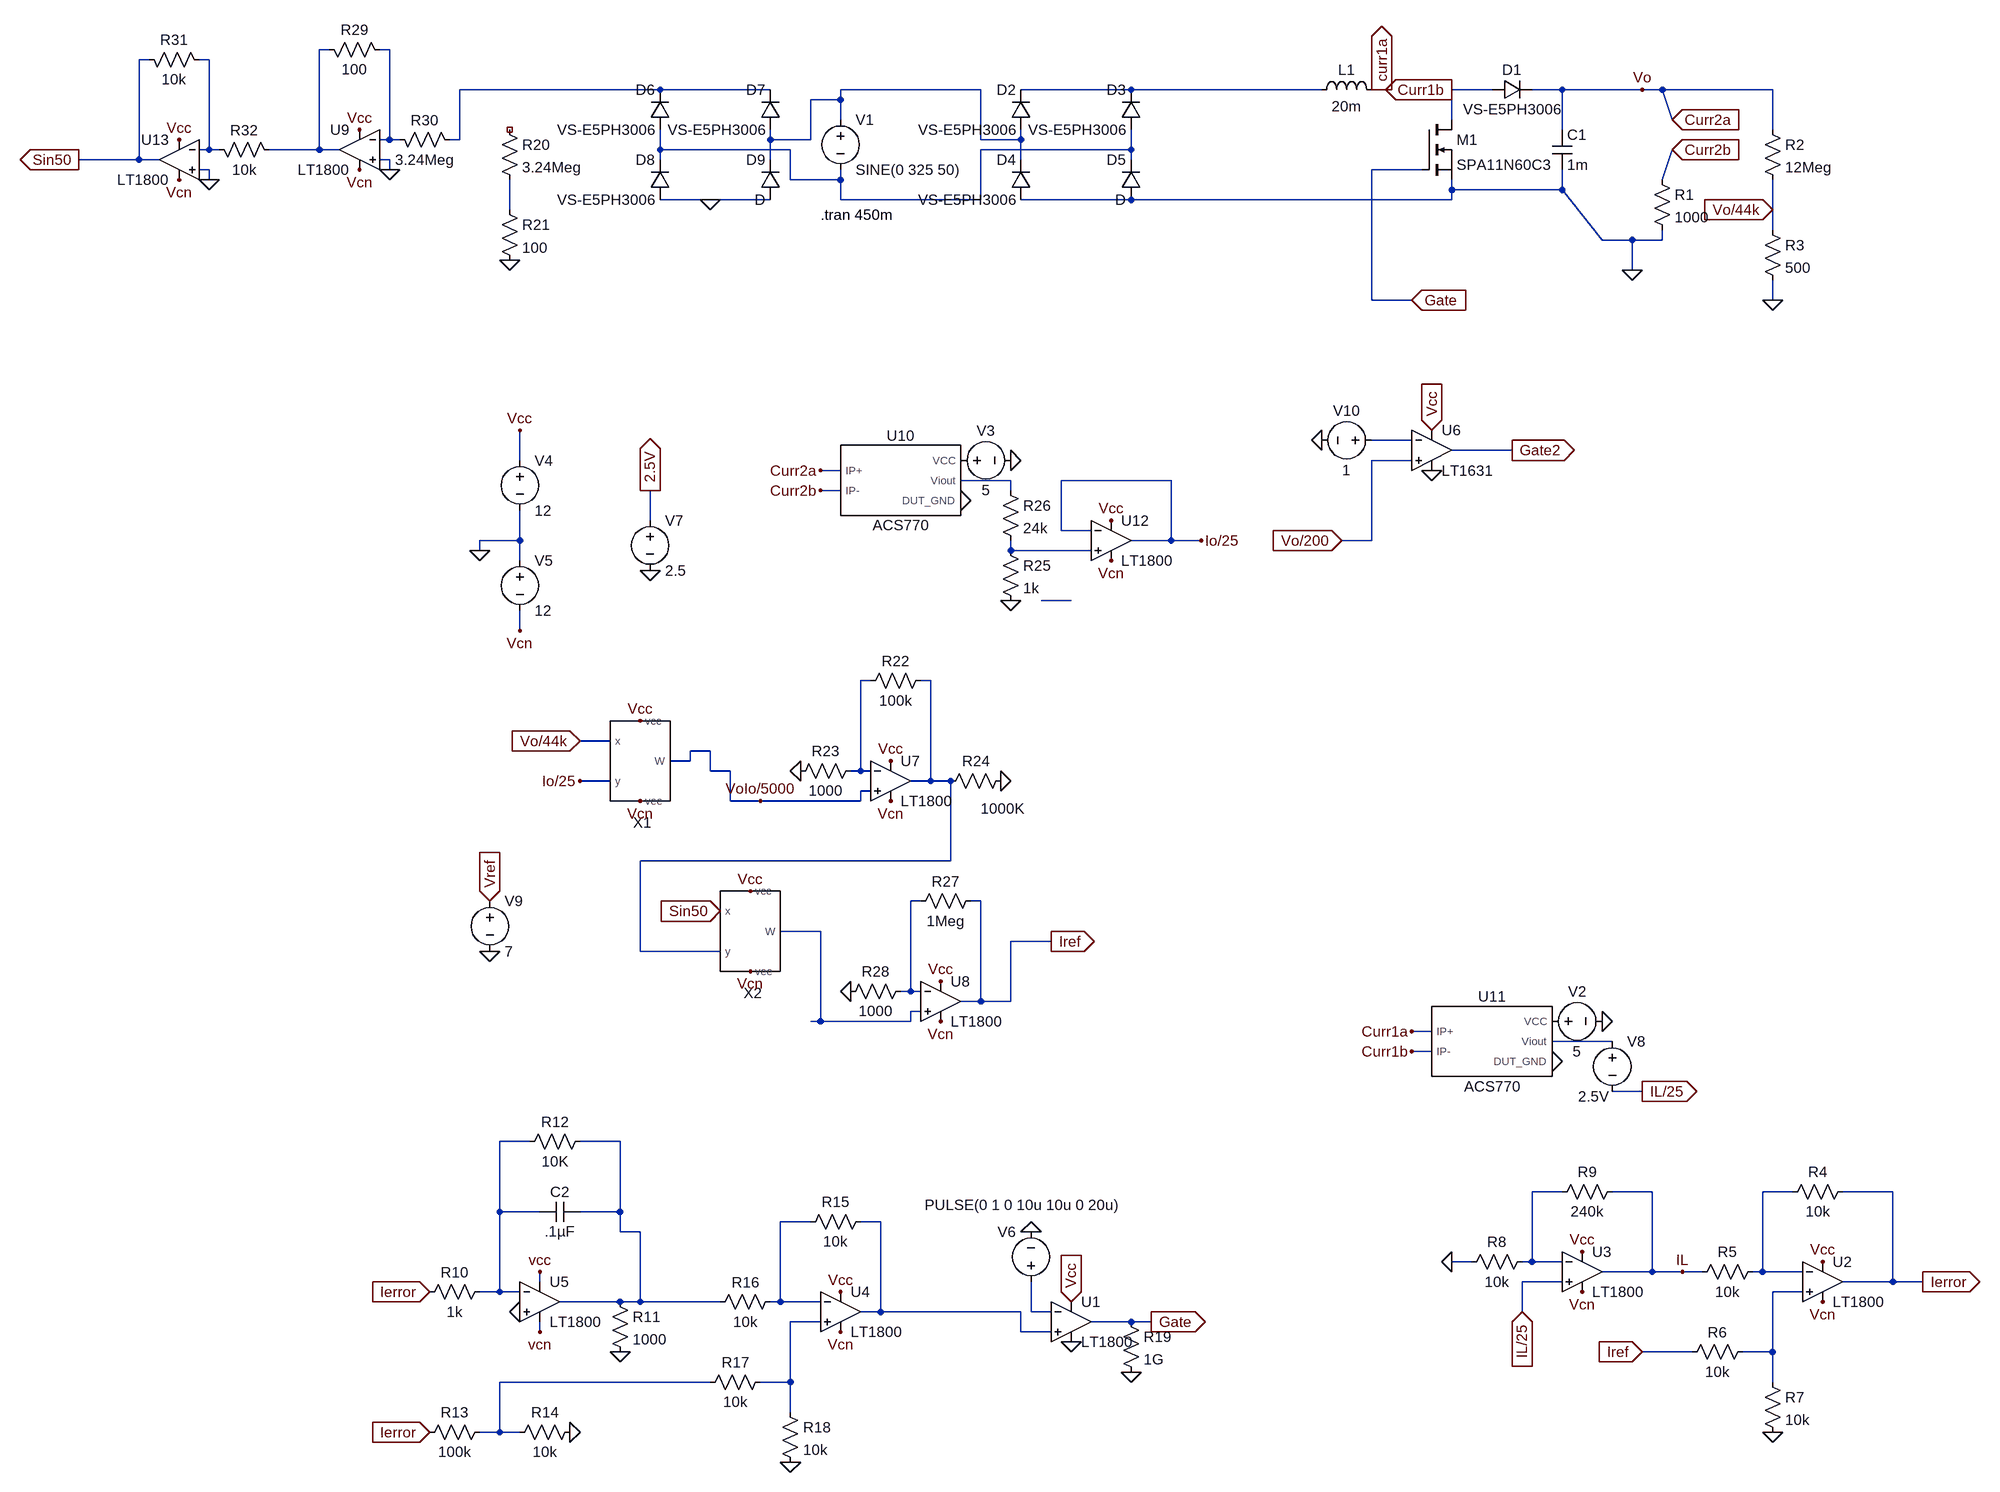
[diagram p0: schematic Test_final.asc]
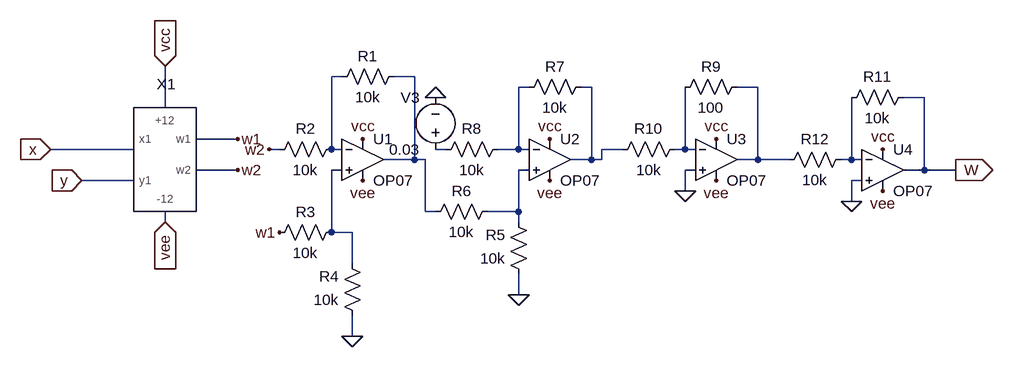
[diagram p1: sub-circuit test_mul_2.asc]
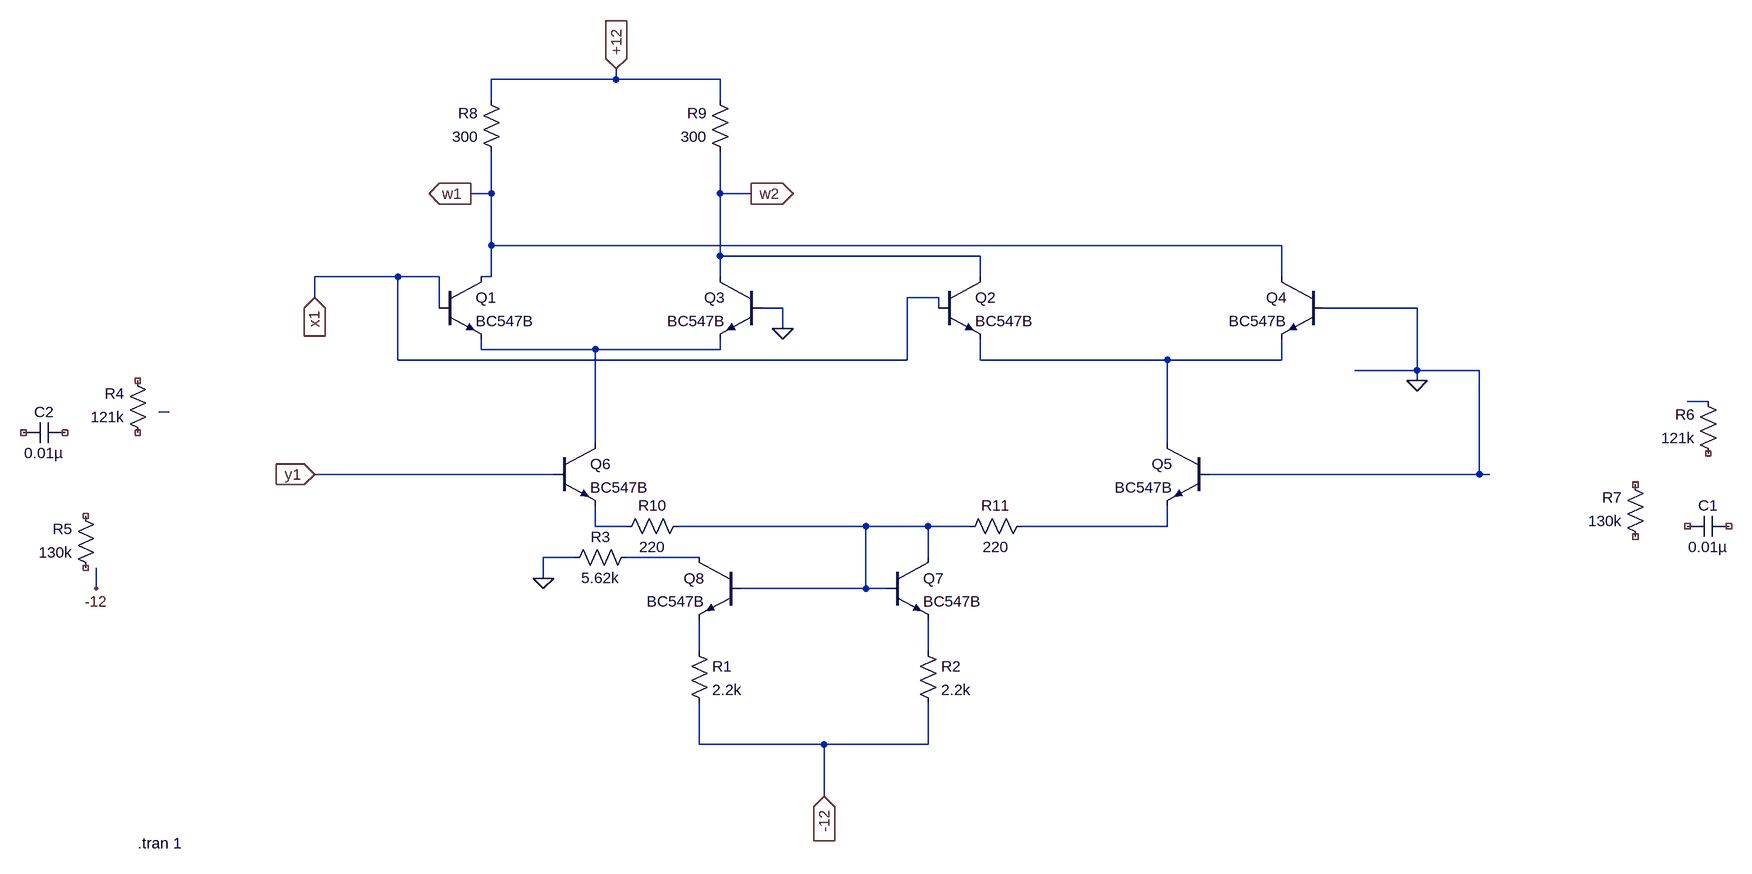
[diagram p2: sub-circuit multipeir_3.asc]
Test_final.asc, the LTspice schematic file:
Version 4.1
SHEET 1 2080 1320
WIRE -592 -960 -608 -960
WIRE -496 -960 -512 -960
WIRE -880 -944 -896 -944
WIRE -784 -944 -800 -944
WIRE -64 -896 -384 -896
WIRE 112 -896 -64 -896
WIRE 448 -896 224 -896
WIRE 688 -896 512 -896
WIRE 992 -896 688 -896
WIRE 1088 -896 1072 -896
WIRE 1104 -896 1088 -896
WIRE 1264 -896 1200 -896
WIRE 1376 -896 1328 -896
WIRE 1504 -896 1376 -896
WIRE 1536 -896 1504 -896
WIRE 1712 -896 1536 -896
WIRE 224 -880 224 -896
WIRE 224 -880 176 -880
WIRE 224 -848 224 -880
WIRE 1200 -848 1200 -896
WIRE 1552 -848 1536 -896
WIRE 1376 -832 1376 -896
WIRE 1712 -832 1712 -896
WIRE -496 -816 -496 -960
WIRE -496 -816 -512 -816
WIRE -480 -816 -496 -816
WIRE -384 -816 -384 -896
WIRE -384 -816 -400 -816
WIRE 112 -816 112 -832
WIRE 176 -816 176 -880
WIRE 176 -816 112 -816
WIRE 448 -816 448 -896
WIRE 512 -816 512 -832
WIRE 512 -816 448 -816
WIRE -784 -800 -784 -944
WIRE -784 -800 -800 -800
WIRE -768 -800 -784 -800
WIRE -608 -800 -608 -960
WIRE -608 -800 -688 -800
WIRE -576 -800 -608 -800
WIRE -64 -800 -64 -832
WIRE 144 -800 -64 -800
WIRE 688 -800 688 -832
WIRE 688 -800 448 -800
WIRE -896 -784 -896 -944
WIRE -896 -784 -992 -784
WIRE -864 -784 -896 -784
WIRE -496 -784 -512 -784
WIRE -64 -784 -64 -800
WIRE 112 -784 112 -816
WIRE 512 -784 512 -816
WIRE 688 -784 688 -800
WIRE -784 -768 -800 -768
WIRE -496 -768 -496 -784
WIRE 1152 -768 1072 -768
WIRE -784 -752 -784 -768
WIRE 144 -752 144 -800
WIRE 224 -752 224 -768
WIRE 224 -752 144 -752
WIRE 1536 -752 1552 -800
WIRE 1200 -736 1200 -752
WIRE 1376 -736 1376 -768
WIRE 1376 -736 1200 -736
WIRE 16 -720 -64 -720
WIRE 112 -720 16 -720
WIRE 224 -720 224 -752
WIRE 448 -720 448 -800
WIRE 448 -720 224 -720
WIRE 688 -720 512 -720
WIRE 1200 -720 1200 -736
WIRE 1200 -720 688 -720
WIRE -304 -704 -304 -752
WIRE 1712 -704 1712 -752
WIRE 1712 -672 1712 -704
WIRE 1440 -656 1376 -736
WIRE 1488 -656 1440 -656
WIRE 1536 -656 1536 -672
WIRE 1536 -656 1488 -656
WIRE 1488 -608 1488 -656
WIRE 1072 -560 1072 -768
WIRE 1136 -560 1072 -560
WIRE 1712 -560 1712 -592
WIRE 1136 -336 1072 -336
WIRE 1296 -320 1200 -320
WIRE -288 -304 -288 -352
WIRE 1136 -304 1072 -304
WIRE 224 -288 192 -288
WIRE 496 -272 416 -272
WIRE 752 -272 576 -272
WIRE 224 -256 192 -256
WIRE 496 -256 496 -272
WIRE -80 -208 -80 -256
WIRE 576 -192 576 -272
WIRE 624 -192 576 -192
WIRE -288 -176 -288 -224
WIRE -288 -176 -352 -176
WIRE 752 -176 752 -272
WIRE 752 -176 688 -176
WIRE 800 -176 752 -176
WIRE 1072 -176 1072 -304
WIRE 1072 -176 1024 -176
WIRE -352 -160 -352 -176
WIRE 496 -160 496 -176
WIRE 624 -160 496 -160
WIRE -288 -144 -288 -176
WIRE 592 -80 544 -80
WIRE -288 -32 -288 -64
WIRE 272 48 256 48
WIRE 368 48 352 48
WIRE -144 144 -192 144
WIRE 16 160 -16 160
WIRE -16 176 -16 160
WIRE -16 176 -48 176
WIRE 16 192 16 160
WIRE 48 192 16 192
WIRE 256 192 256 48
WIRE 256 192 240 192
WIRE 272 192 256 192
WIRE -144 208 -192 208
WIRE 368 208 368 48
WIRE 368 208 336 208
WIRE 400 208 368 208
WIRE 272 224 256 224
WIRE 48 240 48 192
WIRE 96 240 48 240
WIRE 256 240 256 224
WIRE 256 240 96 240
WIRE 400 336 400 208
WIRE 400 336 -96 336
WIRE 352 400 336 400
WIRE 448 400 432 400
WIRE 192 448 128 448
WIRE 560 464 496 464
WIRE -96 480 -96 336
WIRE 32 480 -96 480
WIRE 336 544 336 400
WIRE 336 544 320 544
WIRE 352 544 336 544
WIRE 448 560 448 400
WIRE 448 560 416 560
WIRE 496 560 496 464
WIRE 496 560 448 560
WIRE 352 576 336 576
WIRE 192 592 192 448
WIRE 192 592 176 592
WIRE 336 592 336 576
WIRE 336 592 192 592
WIRE 1168 608 1136 608
WIRE 1456 624 1360 624
WIRE 1168 640 1136 640
WIRE 1504 704 1456 704
WIRE -272 784 -320 784
WIRE -128 784 -192 784
WIRE 1376 864 1328 864
WIRE 1520 864 1456 864
WIRE 1744 864 1696 864
WIRE 1904 864 1824 864
WIRE -320 896 -320 784
WIRE -256 896 -320 896
WIRE -128 896 -128 784
WIRE -128 896 -192 896
WIRE 176 912 128 912
WIRE 288 912 256 912
WIRE -128 928 -128 896
WIRE -96 928 -128 928
WIRE 1232 976 1200 976
WIRE 1328 976 1328 864
WIRE 1328 976 1312 976
WIRE 1376 976 1328 976
WIRE 1520 992 1520 864
WIRE 1520 992 1440 992
WIRE 1568 992 1520 992
WIRE 1600 992 1568 992
WIRE 1696 992 1696 864
WIRE 1696 992 1680 992
WIRE 1760 992 1696 992
WIRE -256 1008 -256 992
WIRE 1376 1008 1312 1008
WIRE 1904 1008 1904 864
WIRE 1904 1008 1824 1008
WIRE 1952 1008 1904 1008
WIRE -320 1024 -320 896
WIRE -320 1024 -352 1024
WIRE -288 1024 -320 1024
WIRE 1760 1024 1712 1024
WIRE -128 1040 -224 1040
WIRE -96 1040 -96 928
WIRE -96 1040 -128 1040
WIRE 32 1040 -96 1040
WIRE 128 1040 128 912
WIRE 128 1040 112 1040
WIRE 192 1040 128 1040
WIRE 288 1056 288 912
WIRE 288 1056 256 1056
WIRE 512 1056 288 1056
WIRE 528 1056 528 1008
WIRE 560 1056 528 1056
WIRE 1312 1056 1312 1008
WIRE 192 1072 144 1072
WIRE 688 1072 624 1072
WIRE 720 1072 688 1072
WIRE -256 1088 -256 1072
WIRE 512 1088 512 1056
WIRE 560 1088 512 1088
WIRE 1584 1120 1504 1120
WIRE 1712 1120 1712 1024
WIRE 1712 1120 1664 1120
WIRE 16 1168 -320 1168
WIRE 144 1168 144 1072
WIRE 144 1168 96 1168
WIRE 1712 1168 1712 1120
WIRE 144 1216 144 1168
WIRE -320 1248 -320 1168
WIRE -320 1248 -352 1248
WIRE -288 1248 -320 1248
FLAG 1712 -560 0
FLAG 1712 -704 Vo/44k
IOPIN 1712 -704 In
FLAG 1504 -896 Vo
FLAG 1088 -896 curr1a
IOPIN 1088 -896 Out
FLAG 1200 -896 Curr1b
IOPIN 1200 -896 Out
FLAG 1136 608 Curr1a
FLAG 1136 640 Curr1b
FLAG 1440 592 0
FLAG 1360 656 0
FLAG 192 -288 Curr2a
FLAG 192 -256 Curr2b
FLAG 496 -304 0
FLAG 416 -240 0
FLAG 1552 -848 Curr2a
IOPIN 1552 -848 In
FLAG 1552 -800 Curr2b
IOPIN 1552 -800 In
FLAG -288 -32 Vcn
FLAG -288 -352 Vcc
FLAG -352 -160 0
FLAG 1712 1248 0
FLAG 1792 976 Vcc
FLAG 1792 1040 Vcn
FLAG 1408 960 Vcc
FLAG 1408 1024 Vcn
FLAG 1312 1056 IL/25
IOPIN 1312 1056 In
FLAG 1200 976 0
FLAG 1504 1120 Iref
IOPIN 1504 1120 In
FLAG 1568 992 IL
FLAG 1952 1008 Ierror
IOPIN 1952 1008 Out
FLAG -256 992 vcc
FLAG -256 1088 vcn
FLAG -288 1056 0
FLAG -128 1120 0
FLAG -432 1024 Ierror
IOPIN -432 1024 In
FLAG -432 1248 Ierror
IOPIN -432 1248 In
FLAG -208 1248 0
FLAG 144 1296 0
FLAG 224 1024 Vcc
FLAG 224 1088 Vcn
FLAG 528 928 0
FLAG 592 1104 0
FLAG 592 1040 Vcc
IOPIN 592 1040 In
FLAG 720 1072 Gate
IOPIN 720 1072 Out
FLAG 688 1152 0
FLAG 1136 -560 Gate
IOPIN 1136 -560 In
FLAG -304 -624 0
FLAG -992 -784 Sin50
IOPIN -992 -784 Out
FLAG 16 -720 0
FLAG -80 -128 0
FLAG -80 -256 2.5V
IOPIN -80 -256 Out
FLAG 1504 704 IL/25
IOPIN 1504 704 Out
FLAG -192 144 Vo/44k
IOPIN -192 144 In
FLAG 32 416 Sin50
IOPIN 32 416 In
FLAG 1168 -352 Vcc
IOPIN 1168 -352 In
FLAG 160 192 0
FLAG 480 208 0
FLAG 96 240 VoIo/5000
FLAG 560 464 Iref
IOPIN 560 464 Out
FLAG -336 480 0
FLAG -336 400 Vref
IOPIN -336 400 In
FLAG 1168 -288 0
FLAG 992 -336 0
FLAG 1024 -176 Vo/200
IOPIN 1024 -176 In
FLAG 1488 -608 0
FLAG 1296 -320 Gate2
IOPIN 1296 -320 Out
FLAG 304 176 Vcc
FLAG 304 240 Vcn
FLAG 496 -80 0
FLAG -96 240 Vcn
FLAG -96 112 Vcc
FLAG 80 512 Vcn
FLAG 80 384 Vcc
FLAG -192 208 Io/25
FLAG 656 -208 Vcc
FLAG 656 -144 Vcn
FLAG 800 -176 Io/25
FLAG 240 544 0
FLAG 384 528 Vcc
FLAG 384 592 Vcn
FLAG -496 -768 0
FLAG -544 -832 Vcc
FLAG -544 -768 Vcn
FLAG -784 -752 0
FLAG -832 -816 Vcc
FLAG -832 -752 Vcn
SYMBOL ind 976 -880 R270
WINDOW 0 32 56 VTop 2
WINDOW 3 5 56 VBottom 2
SYMATTR InstName L1
SYMATTR Value 20m
SYMBOL cap 1360 -832 R0
SYMATTR InstName C1
SYMATTR Value 1m
SYMBOL nmos 1152 -848 R0
SYMATTR InstName M1
SYMATTR Value SPA11N60C3
SYMBOL res 1520 -768 R0
SYMATTR InstName R1
SYMATTR Value 1000
SYMBOL diode 1264 -880 R270
WINDOW 0 32 32 VTop 2
WINDOW 3 0 32 VBottom 2
SYMATTR InstName D1
SYMATTR Value VS-E5PH3006
SYMBOL diode 528 -832 R180
WINDOW 0 24 64 Left 2
WINDOW 3 24 0 Left 2
SYMATTR InstName D2
SYMATTR Value VS-E5PH3006
SYMBOL diode 704 -832 R180
WINDOW 0 24 64 Left 2
WINDOW 3 24 0 Left 2
SYMATTR InstName D3
SYMATTR Value VS-E5PH3006
SYMBOL diode 528 -720 R180
WINDOW 0 24 64 Left 2
WINDOW 3 24 0 Left 2
SYMATTR InstName D4
SYMATTR Value VS-E5PH3006
SYMBOL diode 704 -720 R180
WINDOW 0 24 64 Left 2
WINDOW 3 24 0 Left 2
SYMATTR InstName D5
SYMBOL voltage 224 -864 R0
WINDOW 123 0 0 Left 0
WINDOW 39 0 0 Left 0
SYMATTR InstName V1
SYMATTR Value SINE(0 325 50)
SYMBOL res 1696 -848 R0
SYMATTR InstName R2
SYMATTR Value 12Meg
SYMBOL res 1696 -688 R0
SYMATTR InstName R3
SYMATTR Value 500
SYMBOL voltage 1344 592 R270
WINDOW 0 32 56 VTop 2
WINDOW 3 -32 56 VBottom 2
SYMATTR InstName V2
SYMATTR Value 5
SYMBOL voltage 400 -304 R270
WINDOW 0 32 56 VTop 2
WINDOW 3 -32 56 VBottom 2
SYMATTR InstName V3
SYMATTR Value 5
SYMBOL voltage -288 -320 R0
WINDOW 123 0 0 Left 0
WINDOW 39 0 0 Left 0
SYMATTR InstName V4
SYMATTR Value 12
SYMBOL voltage -288 -160 R0
WINDOW 123 0 0 Left 0
WINDOW 39 0 0 Left 0
SYMATTR InstName V5
SYMATTR Value 12
SYMBOL res 1840 848 R90
WINDOW 0 0 56 VBottom 2
WINDOW 3 32 56 VTop 2
SYMATTR InstName R4
SYMATTR Value 10k
SYMBOL res 1584 1008 R270
WINDOW 0 32 56 VTop 2
WINDOW 3 0 56 VBottom 2
SYMATTR InstName R5
SYMATTR Value 10k
SYMBOL res 1568 1136 R270
WINDOW 0 32 56 VTop 2
WINDOW 3 0 56 VBottom 2
SYMATTR InstName R6
SYMATTR Value 10k
SYMBOL res 1696 1152 R0
SYMATTR InstName R7
SYMATTR Value 10k
SYMBOL res 1328 960 R90
WINDOW 0 0 56 VBottom 2
WINDOW 3 32 56 VTop 2
SYMATTR InstName R8
SYMATTR Value 10k
SYMBOL res 1472 848 R90
WINDOW 0 0 56 VBottom 2
WINDOW 3 32 56 VTop 2
SYMATTR InstName R9
SYMATTR Value 240k
SYMBOL res -336 1008 R90
WINDOW 0 0 56 VBottom 2
WINDOW 3 32 56 VTop 2
SYMATTR InstName R10
SYMATTR Value 1k
SYMBOL res -144 1024 R0
SYMATTR InstName R11
SYMATTR Value 1000
SYMBOL cap -192 880 R90
WINDOW 0 0 32 VBottom 2
WINDOW 3 32 32 VTop 2
SYMATTR InstName C2
SYMATTR Value .1µF
SYMBOL res -176 768 R90
WINDOW 0 0 56 VBottom 2
WINDOW 3 32 56 VTop 2
SYMATTR InstName R12
SYMATTR Value 10K
SYMBOL res -336 1232 R90
WINDOW 0 0 56 VBottom 2
WINDOW 3 32 56 VTop 2
SYMATTR InstName R13
SYMATTR Value 100k
SYMBOL res -192 1232 R90
WINDOW 0 0 56 VBottom 2
WINDOW 3 32 56 VTop 2
SYMATTR InstName R14
SYMATTR Value 10k
SYMBOL res 272 896 R90
WINDOW 0 0 56 VBottom 2
WINDOW 3 32 56 VTop 2
SYMATTR InstName R15
SYMATTR Value 10k
SYMBOL res 16 1056 R270
WINDOW 0 32 56 VTop 2
WINDOW 3 0 56 VBottom 2
SYMATTR InstName R16
SYMATTR Value 10k
SYMBOL res 0 1184 R270
WINDOW 0 32 56 VTop 2
WINDOW 3 0 56 VBottom 2
SYMATTR InstName R17
SYMATTR Value 10k
SYMBOL res 128 1200 R0
SYMATTR InstName R18
SYMATTR Value 10k
SYMBOL voltage 528 1024 R180
WINDOW 0 24 96 Left 2
WINDOW 3 -141 139 Left 2
WINDOW 123 0 0 Left 0
WINDOW 39 0 0 Left 0
SYMATTR InstName V6
SYMATTR Value PULSE(0 1 0 10u 10u 0 20u)
SYMBOL res 672 1056 R0
SYMATTR InstName R19
SYMATTR Value 1G
SYMBOL diode -48 -832 R180
WINDOW 0 24 64 Left 2
WINDOW 3 24 0 Left 2
SYMATTR InstName D6
SYMATTR Value VS-E5PH3006
SYMBOL diode 128 -832 R180
WINDOW 0 24 64 Left 2
WINDOW 3 24 0 Left 2
SYMATTR InstName D7
SYMATTR Value VS-E5PH3006
SYMBOL diode -48 -720 R180
WINDOW 0 24 64 Left 2
WINDOW 3 24 0 Left 2
SYMATTR InstName D8
SYMATTR Value VS-E5PH3006
SYMBOL diode 128 -720 R180
WINDOW 0 24 64 Left 2
WINDOW 3 24 0 Left 2
SYMATTR InstName D9
SYMBOL res -320 -848 R0
SYMATTR InstName R20
SYMATTR Value 3.24Meg
SYMBOL res -320 -720 R0
SYMATTR InstName R21
SYMATTR Value 100
SYMBOL voltage -80 -224 R0
SYMATTR InstName V7
SYMATTR Value 2.5
SYMBOL OpAmps\\LT1800 592 1008 R0
SYMATTR InstName U1
SYMBOL OpAmps\\LT1800 1792 944 R0
SYMATTR InstName U2
SYMBOL OpAmps\\LT1800 1408 928 R0
SYMATTR InstName U3
SYMBOL OpAmps\\LT1800 224 992 R0
SYMATTR InstName U4
SYMBOL OpAmps\\LT1800 -256 976 R0
SYMATTR InstName U5
SYMBOL voltage 1456 608 R0
WINDOW 3 -54 104 Left 2
SYMATTR Value 2.5V
SYMATTR InstName V8
SYMBOL OpAmps\\LT1631 1168 -384 R0
SYMATTR InstName U6
SYMBOL res 368 32 R90
WINDOW 0 0 56 VBottom 2
WINDOW 3 32 56 VTop 2
SYMATTR InstName R22
SYMATTR Value 100k
SYMBOL res 256 176 R90
WINDOW 0 0 56 VBottom 2
WINDOW 3 32 56 VTop 2
SYMATTR InstName R23
SYMATTR Value 1000
SYMBOL res 496 192 R90
WINDOW 0 0 56 VBottom 2
WINDOW 3 44 13 VTop 2
SYMATTR InstName R24
SYMATTR Value 1000K
SYMBOL voltage -336 384 R0
SYMATTR InstName V9
SYMATTR Value 7
SYMBOL voltage 1088 -336 R90
WINDOW 0 -32 56 VBottom 2
WINDOW 3 32 56 VTop 2
WINDOW 123 0 0 Left 0
WINDOW 39 0 0 Left 0
SYMATTR InstName V10
SYMATTR Value 1
SYMBOL OpAmps\\LT1800 304 144 R0
SYMATTR InstName U7
SYMBOL ACS770 320 -272 R0
SYMATTR InstName U10
SYMBOL ACS770 1264 624 R0
SYMATTR InstName U11
SYMBOL res 480 -176 R0
SYMATTR InstName R25
SYMATTR Value 1k
SYMBOL res 480 -272 R0
SYMATTR InstName R26
SYMATTR Value 24k
SYMBOL test_mul_2 -96 192 R0
SYMATTR InstName X1
SYMBOL test_mul_2 80 464 R0
SYMATTR InstName X2
SYMBOL OpAmps\\LT1800 656 -240 R0
SYMATTR InstName U12
SYMBOL res 448 384 R90
WINDOW 0 0 56 VBottom 2
WINDOW 3 32 56 VTop 2
SYMATTR InstName R27
SYMATTR Value 1Meg
SYMBOL res 336 528 R90
WINDOW 0 0 56 VBottom 2
WINDOW 3 32 56 VTop 2
SYMATTR InstName R28
SYMATTR Value 1000
SYMBOL OpAmps\\LT1800 384 496 R0
SYMATTR InstName U8
SYMBOL res -608 -976 M90
WINDOW 0 0 56 VBottom 2
WINDOW 3 32 56 VTop 2
SYMATTR InstName R29
SYMATTR Value 100
SYMBOL res -496 -832 M90
WINDOW 0 0 56 VBottom 2
WINDOW 3 32 56 VTop 2
SYMATTR InstName R30
SYMATTR Value 3.24Meg
SYMBOL OpAmps\\LT1800 -544 -864 M0
SYMATTR InstName U9
SYMBOL res -896 -960 M90
WINDOW 0 0 56 VBottom 2
WINDOW 3 32 56 VTop 2
SYMATTR InstName R31
SYMATTR Value 10k
SYMBOL res -784 -816 M90
WINDOW 0 0 56 VBottom 2
WINDOW 3 32 56 VTop 2
SYMATTR InstName R32
SYMATTR Value 10k
SYMBOL OpAmps\\LT1800 -832 -848 M0
SYMATTR InstName U13
TEXT 192 -696 Left 2 !.tran 450m

test_mul_2.asc, the sub-circuit schematic file:
Version 4.1
SHEET 1 900 680
WIRE -128 -32 -144 -32
WIRE -16 -32 -48 -32
WIRE 160 -16 144 -16
WIRE 256 -16 240 -16
WIRE 512 -16 480 -16
WIRE 768 0 736 0
WIRE -400 16 -400 -48
WIRE -288 64 -352 64
WIRE -448 80 -448 64
WIRE -448 80 -576 80
WIRE -224 80 -240 80
WIRE -144 80 -144 -32
WIRE -128 80 -144 80
WIRE 32 80 16 80
WIRE 144 80 144 -16
WIRE 144 80 112 80
WIRE 160 80 144 80
WIRE 304 80 272 80
WIRE 400 80 400 -16
WIRE 400 80 384 80
WIRE 416 80 400 80
WIRE -16 96 -16 -32
WIRE -16 96 -64 96
WIRE 0 96 -16 96
WIRE 256 96 256 -16
WIRE 256 96 224 96
WIRE 272 96 272 80
WIRE 272 96 256 96
WIRE 512 96 512 -16
WIRE 512 96 480 96
WIRE 560 96 512 96
WIRE 656 96 656 0
WIRE 656 96 640 96
WIRE 672 96 656 96
WIRE -288 112 -352 112
WIRE -128 112 -144 112
WIRE 160 112 144 112
WIRE 416 112 400 112
WIRE 768 112 768 0
WIRE 768 112 736 112
WIRE 816 112 768 112
WIRE -448 128 -528 128
WIRE 672 128 656 128
WIRE 400 144 400 112
WIRE 656 160 656 128
WIRE 0 176 0 96
WIRE 16 176 0 176
WIRE 144 176 144 112
WIRE 144 176 96 176
WIRE -400 192 -400 176
WIRE 144 192 144 176
WIRE -144 208 -144 112
WIRE -112 208 -144 208
WIRE -112 256 -112 208
WIRE 144 304 144 272
WIRE -112 368 -112 336
FLAG -288 64 w1
FLAG -288 112 w2
FLAG -112 368 0
FLAG -240 80 w2
FLAG -224 208 w1
FLAG 400 144 0
FLAG 144 304 0
FLAG -400 -48 vcc
IOPIN -400 -48 In
FLAG -96 64 vcc
FLAG 192 64 vcc
FLAG 448 64 vcc
FLAG 448 128 vee
FLAG 192 128 vee
FLAG -96 128 vee
FLAG -400 192 vee
IOPIN -400 192 In
FLAG 16 0 0
FLAG 656 160 0
FLAG 704 80 vcc
FLAG 704 144 vee
FLAG -576 80 x
IOPIN -576 80 In
FLAG -528 128 y
IOPIN -528 128 In
FLAG 816 112 W
IOPIN 816 112 Out
SYMBOL multipeir_3 -400 96 R0
SYMATTR InstName X1
SYMBOL OpAmps\\OP07 -96 32 R0
SYMATTR InstName U1
SYMBOL OpAmps\\OP07 192 32 R0
SYMATTR InstName U2
SYMBOL OpAmps\\OP07 448 32 R0
SYMATTR InstName U3
SYMBOL res -32 -48 R90
WINDOW 0 0 56 VBottom 2
WINDOW 3 32 56 VTop 2
SYMATTR InstName R1
SYMATTR Value 10k
SYMBOL res -128 64 R90
WINDOW 0 0 56 VBottom 2
WINDOW 3 32 56 VTop 2
SYMATTR InstName R2
SYMATTR Value 10k
SYMBOL res -128 192 R90
WINDOW 0 0 56 VBottom 2
WINDOW 3 32 56 VTop 2
SYMATTR InstName R3
SYMATTR Value 10k
SYMBOL res -96 352 R180
WINDOW 0 36 76 Left 2
WINDOW 3 36 40 Left 2
SYMATTR InstName R4
SYMATTR Value 10k
SYMBOL res 160 288 R180
WINDOW 0 36 76 Left 2
WINDOW 3 36 40 Left 2
SYMATTR InstName R5
SYMATTR Value 10k
SYMBOL res 0 192 R270
WINDOW 0 32 56 VTop 2
WINDOW 3 0 56 VBottom 2
SYMATTR InstName R6
SYMATTR Value 10k
SYMBOL res 144 0 R270
WINDOW 0 32 56 VTop 2
WINDOW 3 0 56 VBottom 2
SYMATTR InstName R7
SYMATTR Value 10k
SYMBOL res 16 96 R270
WINDOW 0 32 56 VTop 2
WINDOW 3 0 56 VBottom 2
SYMATTR InstName R8
SYMATTR Value 10k
SYMBOL res 496 -32 R90
WINDOW 0 0 56 VBottom 2
WINDOW 3 32 56 VTop 2
SYMATTR InstName R9
SYMATTR Value 100
SYMBOL res 400 64 R90
WINDOW 0 0 56 VBottom 2
WINDOW 3 32 56 VTop 2
SYMATTR InstName R10
SYMATTR Value 10k
SYMBOL voltage 16 96 R180
WINDOW 0 24 96 Left 2
WINDOW 3 24 16 Left 2
WINDOW 123 0 0 Left 0
WINDOW 39 0 0 Left 0
SYMATTR InstName V3
SYMATTR Value 0.03
SYMBOL OpAmps\\OP07 704 48 R0
SYMATTR InstName U4
SYMBOL res 752 -16 R90
WINDOW 0 0 56 VBottom 2
WINDOW 3 32 56 VTop 2
SYMATTR InstName R11
SYMATTR Value 10k
SYMBOL res 656 80 R90
WINDOW 0 0 56 VBottom 2
WINDOW 3 32 56 VTop 2
SYMATTR InstName R12
SYMATTR Value 10k

multipeir_3.asc, the sub-circuit schematic file:
Version 4.1
SHEET 1 2080 996
WIRE 240 -208 240 -224
WIRE 240 -208 48 -208
WIRE 400 -208 240 -208
WIRE 48 -176 48 -208
WIRE 400 -176 400 -208
WIRE 48 -32 48 -96
WIRE 48 -32 16 -32
WIRE 400 -32 400 -96
WIRE 448 -32 400 -32
WIRE 48 48 48 -32
WIRE 1264 48 48 48
WIRE 400 64 400 -32
WIRE 800 64 400 64
WIRE -96 96 -224 96
WIRE -32 96 -96 96
WIRE 48 96 48 48
WIRE 48 96 32 96
WIRE 400 96 400 64
WIRE 800 96 800 64
WIRE 1264 96 1264 48
WIRE -224 128 -224 96
WIRE 736 128 688 128
WIRE -32 144 -32 96
WIRE 496 144 464 144
WIRE 736 144 736 128
WIRE 1472 144 1328 144
WIRE 496 176 496 144
WIRE 32 208 32 192
WIRE 208 208 32 208
WIRE 400 208 400 192
WIRE 400 208 208 208
WIRE -96 224 -96 96
WIRE 688 224 688 128
WIRE 688 224 -96 224
WIRE 800 224 800 192
WIRE 1088 224 800 224
WIRE 1264 224 1264 192
WIRE 1264 224 1088 224
WIRE 1472 240 1472 144
WIRE 1472 240 1376 240
WIRE 1568 240 1472 240
WIRE 1472 256 1472 240
WIRE 1920 288 1888 288
WIRE -448 304 -464 304
WIRE 208 352 208 208
WIRE 1088 352 1088 224
WIRE 144 400 -224 400
WIRE 1568 400 1568 240
WIRE 1568 400 1152 400
WIRE 1584 400 1568 400
WIRE 208 480 208 448
WIRE 256 480 208 480
WIRE 624 480 336 480
WIRE 720 480 624 480
WIRE 784 480 720 480
WIRE 1088 480 1088 448
WIRE 1088 480 864 480
WIRE 176 528 128 528
WIRE 368 528 256 528
WIRE 720 528 720 480
WIRE 128 560 128 528
WIRE -560 576 -560 544
WIRE 624 576 624 480
WIRE 624 576 432 576
WIRE 656 576 624 576
WIRE 368 672 368 624
WIRE 720 672 720 624
WIRE 368 816 368 752
WIRE 560 816 368 816
WIRE 720 816 720 752
WIRE 720 816 560 816
WIRE 560 896 560 816
FLAG 1472 256 0
FLAG 128 560 0
FLAG -560 576 -12
FLAG 496 176 0
FLAG 240 -224 +12
IOPIN 240 -224 In
FLAG 560 896 -12
IOPIN 560 896 In
FLAG -224 128 x1
IOPIN -224 128 In
FLAG -224 400 y1
IOPIN -224 400 In
FLAG 16 -32 w1
IOPIN 16 -32 Out
FLAG 448 -32 w2
IOPIN 448 -32 Out
SYMBOL npn -32 96 R0
SYMATTR InstName Q1
SYMATTR Value BC547B
SYMBOL npn 736 96 R0
SYMATTR InstName Q2
SYMATTR Value BC547B
SYMBOL npn 464 96 M0
SYMATTR InstName Q3
SYMATTR Value BC547B
SYMBOL npn 1328 96 M0
SYMATTR InstName Q4
SYMATTR Value BC547B
SYMBOL npn 1152 352 M0
SYMATTR InstName Q5
SYMATTR Value BC547B
SYMBOL npn 144 352 R0
SYMATTR InstName Q6
SYMATTR Value BC547B
SYMBOL npn 656 528 R0
SYMATTR InstName Q7
SYMATTR Value BC547B
SYMBOL npn 432 528 M0
SYMATTR InstName Q8
SYMATTR Value BC547B
SYMBOL res 352 656 R0
SYMATTR InstName R1
SYMATTR Value 2.2k
SYMBOL res 704 656 R0
SYMATTR InstName R2
SYMATTR Value 2.2k
SYMBOL res 272 512 R90
WINDOW 0 0 56 VBottom 2
WINDOW 3 32 56 VTop 2
SYMATTR InstName R3
SYMATTR Value 5.62k
SYMBOL res -480 352 R180
WINDOW 0 36 76 Left 2
WINDOW 3 36 40 Left 2
SYMATTR InstName R4
SYMATTR Value 121k
SYMATTR SpiceLine tol=0 pwr=0
SYMBOL res -560 560 R180
WINDOW 0 36 76 Left 2
WINDOW 3 36 40 Left 2
SYMATTR InstName R5
SYMATTR Value 130k
SYMBOL res 1936 384 R180
WINDOW 0 36 76 Left 2
WINDOW 3 36 40 Left 2
SYMATTR InstName R6
SYMATTR Value 121k
SYMBOL res 1824 512 R180
WINDOW 0 36 76 Left 2
WINDOW 3 36 40 Left 2
SYMATTR InstName R7
SYMATTR Value 130k
SYMBOL res 64 -80 R180
WINDOW 0 36 76 Left 2
WINDOW 3 36 40 Left 2
SYMATTR InstName R8
SYMATTR Value 300
SYMBOL res 416 -80 R180
WINDOW 0 36 76 Left 2
WINDOW 3 36 40 Left 2
SYMATTR InstName R9
SYMATTR Value 300
SYMBOL cap 1952 464 R90
WINDOW 0 0 32 VBottom 2
WINDOW 3 32 32 VTop 2
SYMATTR InstName C1
SYMATTR Value 0.01µ
SYMBOL cap -608 320 R90
WINDOW 0 0 32 VBottom 2
WINDOW 3 32 32 VTop 2
SYMATTR InstName C2
SYMATTR Value 0.01µ
SYMBOL res 352 464 R90
WINDOW 0 0 56 VBottom 2
WINDOW 3 32 56 VTop 2
SYMATTR InstName R10
SYMATTR Value 220
SYMBOL res 880 464 R90
WINDOW 0 0 56 VBottom 2
WINDOW 3 32 56 VTop 2
SYMATTR InstName R11
SYMATTR Value 220
TEXT -496 968 Left 2 !.tran 1

The netlist it stands for:
* Test_final.asc
L1 N006 curr1a 20m
C1 Curr2a 0 1m
M1 Curr1b Gate 0 0 SPA11N60C3
R1 Curr2b 0 1000
D1 Curr1b Curr2a VS-E5PH3006
D2 N005 N006 VS-E5PH3006
D3 N007 N006 VS-E5PH3006
D4 0 N005 VS-E5PH3006
D5 0 N007 D
V1 N005 N007 SINE(0 325 50)
R2 Curr2a Vo/44k 12Meg
R3 Vo/44k 0 500
V2 P001 0 5
V3 P002 0 5
V4 Vcc 0 12
V5 0 Vcn 12
R4 Ierror N021 10k
R5 IL N021 10k
R6 Iref N024 10k
R7 N024 0 10k
R8 N020 0 10k
R9 IL N020 240k
R10 N018 Ierror 1k
R11 N019 0 1000
C2 N019 N018 .1µF
R12 N019 N018 10K
R13 N027 Ierror 100k
R14 0 N027 10k
R15 N023 N022 10k
R16 N019 N022 10k
R17 N027 N026 10k
R18 N026 0 10k
V6 N025 0 PULSE(0 1 0 10u 10u 0 20u)
R19 Gate 0 1G
D6 N007 N004 VS-E5PH3006
D7 N005 N004 VS-E5PH3006
D8 0 N007 VS-E5PH3006
D9 0 N005 D
R20 NC_01 N008 3.24Meg
R21 N008 0 100
V7 2.5V 0 2.5
X§U1 N023 N025 Vcc 0 Gate LT1800  ; pins In+ In- V+ V- OUT
X§U2 N024 N021 Vcc Vcn Ierror LT1800  ; pins In+ In- V+ V- OUT
X§U3 IL/25 N020 Vcc Vcn IL LT1800  ; pins In+ In- V+ V- OUT
X§U4 N026 N022 Vcc Vcn N023 LT1800  ; pins In+ In- V+ V- OUT
X§U5 0 N018 Vcc Vcn N019 LT1800  ; pins In+ In- V+ V- OUT
V8 N017 IL/25 2.5V
X§U6 Vo/200 N009 Vcc 0 Gate2 LT1630  ; LT1631, pins In+ In- V+ V- OUT
R22 N014 N013 100k
R23 N013 0 1000
R24 0 N014 1000K
V9 Vref 0 7
V10 N009 0 1
X§U7 VoIo/5000 N013 Vcc Vcn N014 LT1800  ; pins In+ In- V+ V- OUT
X§U10 Curr2a Curr2b P002 N010 0 ACS770  ; pins IP+ IP- VCC Viout DUT_GND
X§U11 curr1a Curr1b P001 N017 0 ACS770  ; pins IP+ IP- VCC Viout DUT_GND
R25 N011 0 1k
R26 N010 N011 24k
X§X1 Vcc Vcn Vo/44k Io/25 VoIo/5000 test_mul_2
X§X2 Vcc Vcn Sin50 N014 N016 test_mul_2
X§U12 N011 Io/25 Vcc Vcn Io/25 LT1800  ; pins In+ In- V+ V- OUT
R27 Iref N015 1Meg
R28 N015 0 1000
X§U8 N016 N015 Vcc Vcn Iref LT1800  ; pins In+ In- V+ V- OUT
R29 N001 N002 100
R30 N002 N004 3.24Meg
X§U9 0 N002 Vcc Vcn N001 LT1800  ; pins In+ In- V+ V- OUT
R31 Sin50 N003 10k
R32 N003 N001 10k
X§U13 0 N003 Vcc Vcn Sin50 LT1800  ; pins In+ In- V+ V- OUT

* block symbol definitions
.subckt test_mul_2 vcc vee x y W
X§X1 vcc vee x y w2 w1 multipeir_3
X§U1 N009 N001 vcc vee N002 LT1001  ; OP07, pins In+ In- V+ V- OUT
X§U2 N010 N003 vcc vee N004 LT1001  ; OP07, pins In+ In- V+ V- OUT
X§U3 0 N007 vcc vee N005 LT1001  ; OP07, pins In+ In- V+ V- OUT
R1 N002 N001 10k
R2 N001 w2 10k
R3 N009 w1 10k
R4 0 N009 10k
R5 0 N010 10k
R6 N002 N010 10k
R7 N003 N004 10k
R8 N006 N003 10k
R9 N005 N007 100
R10 N007 N004 10k
V3 N006 0 0.03
X§U4 0 N008 vcc vee W LT1001  ; OP07, pins In+ In- V+ V- OUT
R11 W N008 10k
R12 N008 N005 10k
.ends test_mul_2

.subckt multipeir_3 +12 -12 x1 y1 w2 w1
Q1 w1 x1 N001 0 BC547B
Q2 w2 x1 N002 0 BC547B
Q3 w2 0 N001 0 BC547B
Q4 w1 0 N002 0 BC547B
Q5 N002 0 N007 0 BC547B
Q6 N001 y1 N005 0 BC547B
Q7 N006 N006 N010 0 BC547B
Q8 N008 N006 N009 0 BC547B
R1 N009 -12 2.2k
R2 N010 -12 2.2k
R3 N008 0 5.62k
R4 NC_01 NC_02 121k tol=0 pwr=0
R5 NC_03 NC_04 130k
R6 NC_05 N003 121k
R7 NC_06 NC_07 130k
R8 w1 +12 300
R9 w2 +12 300
C1 NC_08 NC_09 0.01µ
C2 NC_10 NC_11 0.01µ
R10 N006 N005 220
R11 N007 N006 220
.tran 1
.ends multipeir_3

.model D D
.lib standard.dio
.model NPN NPN
.model PNP PNP
.lib standard.bjt
.model NMOS NMOS
.model PMOS PMOS
.lib standard.mos
.tran 450m
.lib LTC.lib
.lib C:\Users\Vinayaka\OneDrive\Desktop\PFC circuit\files\ACS770.lib
.backanno
.end